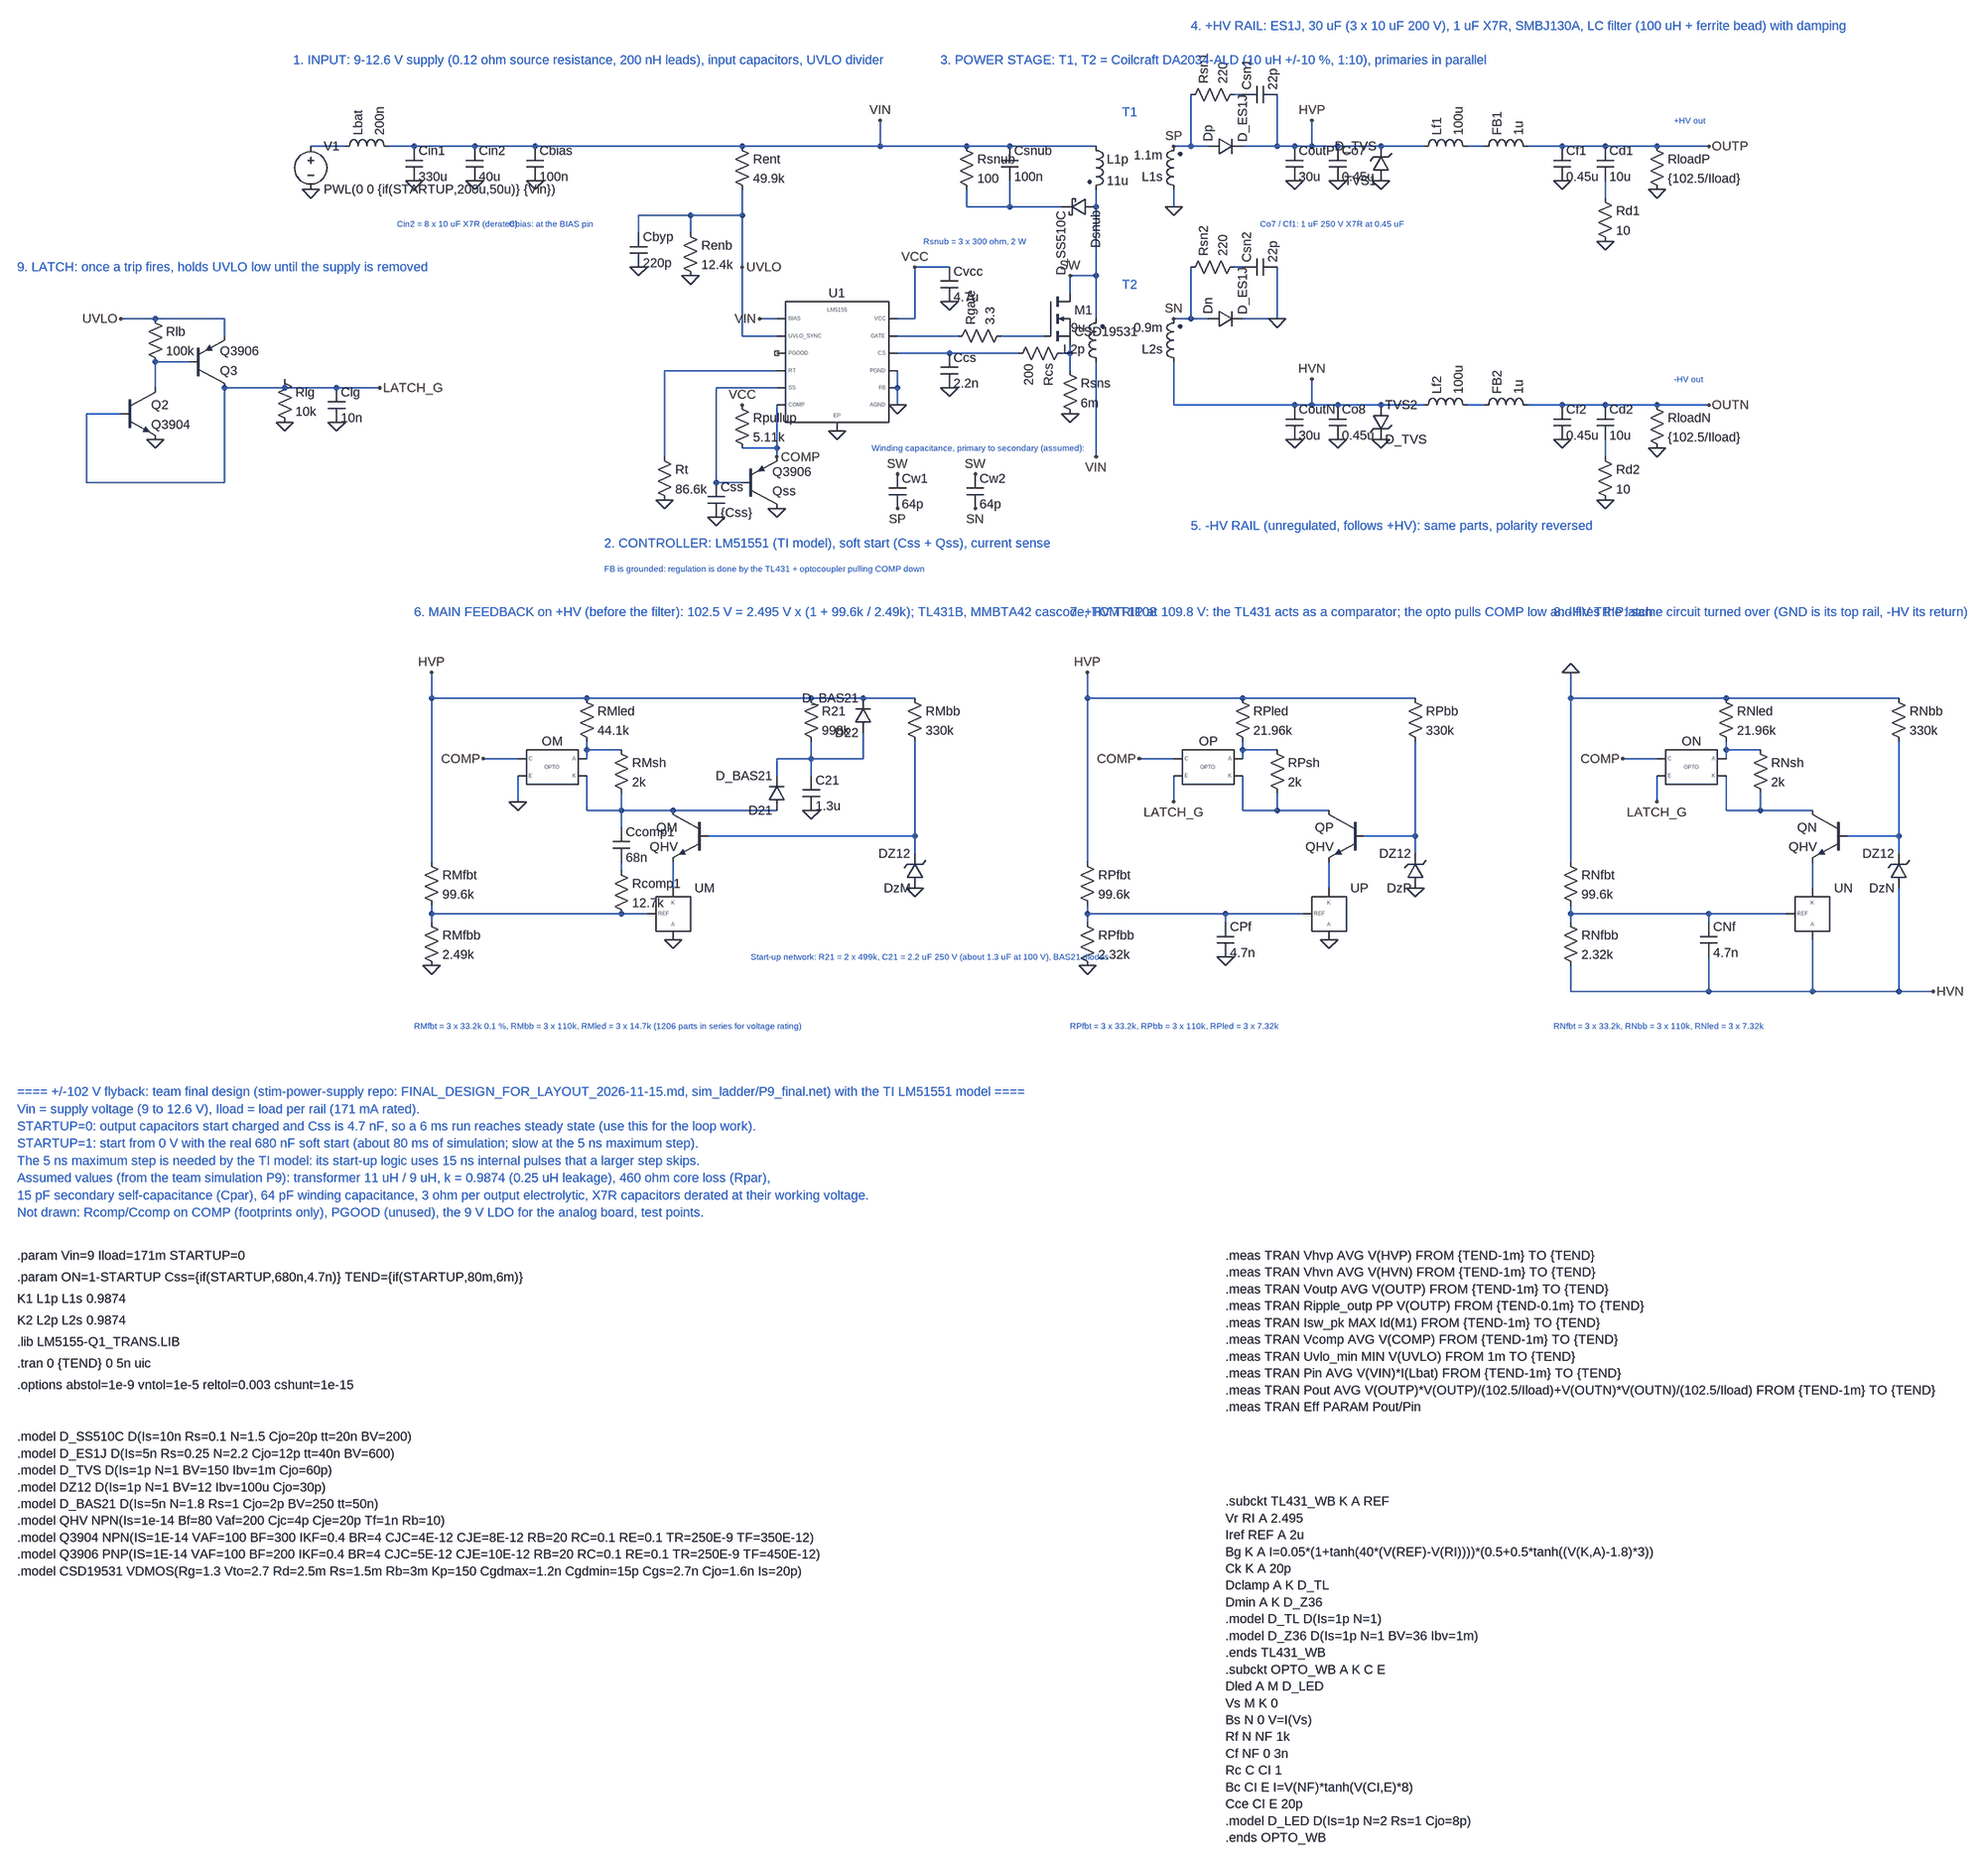
[diagram p0: schematic LM51551_flyback_team_final.asc]
LM51551_flyback_team_final.asc, the LTspice schematic file:
Version 4.1
SHEET 1 3200 2000
WIRE -832 496 -832 624
WIRE -832 496 -768 496
WIRE -832 624 -576 624
WIRE -768 320 -704 320
WIRE -704 320 -576 320
WIRE -704 400 -704 448
WIRE -704 400 -640 400
WIRE -576 320 -576 352
WIRE -576 448 -576 624
WIRE -576 448 -464 448
WIRE -464 432 -464 448
WIRE -464 448 -368 448
WIRE -416 0 -352 0
WIRE -368 448 -288 448
WIRE -272 0 -224 0
WIRE -224 0 -112 0
WIRE -192 976 -192 1024
WIRE -192 1024 -192 1328
WIRE -192 1024 96 1024
WIRE -192 1408 -192 1424
WIRE -192 1424 -192 1440
WIRE -192 1424 64 1424
WIRE -112 0 0 0
WIRE -96 1136 -32 1136
WIRE -32 1168 -32 1216
WIRE 0 0 384 0
WIRE 64 1424 160 1424
WIRE 96 1024 512 1024
WIRE 96 1104 96 1120
WIRE 96 1120 96 1136
WIRE 96 1120 160 1120
WIRE 96 1168 96 1232
WIRE 96 1232 160 1232
WIRE 160 1200 160 1232
WIRE 160 1232 160 1264
WIRE 160 1232 256 1232
WIRE 160 1328 160 1344
WIRE 160 1424 208 1424
WIRE 192 128 192 160
WIRE 192 128 288 128
WIRE 240 416 240 576
WIRE 240 416 448 416
WIRE 256 1232 448 1232
WIRE 256 1328 256 1376
WIRE 288 128 288 160
WIRE 288 128 384 128
WIRE 320 1280 704 1280
WIRE 336 448 336 624
WIRE 336 448 448 448
WIRE 336 624 384 624
WIRE 384 0 640 0
WIRE 384 80 384 128
WIRE 384 128 384 224
WIRE 384 224 384 352
WIRE 384 352 448 352
WIRE 384 560 448 560
WIRE 416 320 448 320
WIRE 448 480 448 560
WIRE 448 560 448 576
WIRE 448 1136 448 1168
WIRE 448 1136 512 1136
WIRE 512 1024 608 1024
WIRE 512 1104 512 1136
WIRE 512 1136 512 1168
WIRE 512 1136 608 1136
WIRE 608 1024 704 1024
WIRE 608 1088 608 1136
WIRE 640 -48 640 0
WIRE 640 0 800 0
WIRE 672 320 704 320
WIRE 672 352 784 352
WIRE 672 384 768 384
WIRE 672 416 672 448
WIRE 672 448 672 480
WIRE 704 224 704 320
WIRE 704 224 768 224
WIRE 704 1104 704 1280
WIRE 704 1280 704 1312
WIRE 768 384 896 384
WIRE 800 0 880 0
WIRE 800 80 800 112
WIRE 800 112 880 112
WIRE 864 352 944 352
WIRE 880 0 1040 0
WIRE 880 64 880 112
WIRE 880 112 976 112
WIRE 976 384 992 384
WIRE 992 240 992 272
WIRE 992 240 1040 240
WIRE 992 368 992 384
WIRE 992 384 992 416
WIRE 1024 976 1024 1024
WIRE 1024 1024 1024 1328
WIRE 1024 1024 1312 1024
WIRE 1024 1408 1024 1424
WIRE 1024 1424 1024 1440
WIRE 1024 1424 1280 1424
WIRE 1040 80 1040 112
WIRE 1040 112 1040 240
WIRE 1040 240 1040 320
WIRE 1040 400 1040 576
WIRE 1120 1136 1184 1136
WIRE 1184 0 1216 0
WIRE 1184 80 1184 112
WIRE 1184 320 1216 320
WIRE 1184 400 1184 480
WIRE 1184 480 1408 480
WIRE 1184 1168 1184 1216
WIRE 1216 -96 1216 0
WIRE 1216 0 1248 0
WIRE 1216 224 1216 320
WIRE 1216 320 1248 320
WIRE 1280 1424 1280 1440
WIRE 1280 1424 1376 1424
WIRE 1296 -96 1312 -96
WIRE 1296 224 1312 224
WIRE 1312 0 1376 0
WIRE 1312 320 1376 320
WIRE 1312 1024 1632 1024
WIRE 1312 1104 1312 1120
WIRE 1312 1120 1312 1136
WIRE 1312 1120 1376 1120
WIRE 1312 1168 1312 1232
WIRE 1312 1232 1376 1232
WIRE 1376 -96 1376 0
WIRE 1376 0 1408 0
WIRE 1376 224 1376 320
WIRE 1376 1200 1376 1232
WIRE 1376 1232 1472 1232
WIRE 1376 1424 1424 1424
WIRE 1408 0 1440 0
WIRE 1408 480 1440 480
WIRE 1440 -48 1440 0
WIRE 1440 0 1488 0
WIRE 1440 432 1440 480
WIRE 1440 480 1488 480
WIRE 1472 1328 1472 1376
WIRE 1488 0 1568 0
WIRE 1488 480 1568 480
WIRE 1536 1280 1632 1280
WIRE 1568 0 1648 0
WIRE 1568 480 1648 480
WIRE 1632 1104 1632 1280
WIRE 1632 1280 1632 1312
WIRE 1728 0 1760 0
WIRE 1728 480 1760 480
WIRE 1840 0 1904 0
WIRE 1840 480 1904 480
WIRE 1904 0 1984 0
WIRE 1904 480 1984 480
WIRE 1920 976 1920 1024
WIRE 1920 1024 1920 1328
WIRE 1920 1024 2208 1024
WIRE 1920 1408 1920 1424
WIRE 1920 1424 1920 1440
WIRE 1920 1424 2176 1424
WIRE 1920 1520 1920 1568
WIRE 1920 1568 2176 1568
WIRE 1984 0 2080 0
WIRE 1984 64 1984 96
WIRE 1984 480 2080 480
WIRE 1984 544 1984 576
WIRE 2016 1136 2080 1136
WIRE 2080 0 2176 0
WIRE 2080 480 2176 480
WIRE 2080 1168 2080 1216
WIRE 2176 1424 2176 1440
WIRE 2176 1424 2272 1424
WIRE 2176 1504 2176 1568
WIRE 2176 1568 2368 1568
WIRE 2208 1024 2528 1024
WIRE 2208 1104 2208 1120
WIRE 2208 1120 2208 1136
WIRE 2208 1120 2272 1120
WIRE 2208 1168 2208 1232
WIRE 2208 1232 2272 1232
WIRE 2272 1200 2272 1232
WIRE 2272 1232 2368 1232
WIRE 2272 1424 2320 1424
WIRE 2368 1328 2368 1376
WIRE 2368 1472 2368 1568
WIRE 2368 1568 2528 1568
WIRE 2432 1280 2528 1280
WIRE 2528 1104 2528 1280
WIRE 2528 1280 2528 1312
WIRE 2528 1376 2528 1568
WIRE 2528 1568 2592 1568
FLAG -416 80 0
FLAG -224 64 0
FLAG -112 64 0
FLAG 0 64 0
FLAG 288 240 0
FLAG 192 224 0
FLAG 384 224 UVLO
FLAG 416 320 VIN
FLAG 240 656 0
FLAG 336 688 0
FLAG 448 672 0
FLAG 384 480 VCC
FLAG 448 576 COMP
FLAG 768 288 0
FLAG 704 224 VCC
FLAG 672 480 0
FLAG 560 528 0
FLAG 1040 576 VIN
FLAG 640 -48 VIN
FLAG 992 240 SW
FLAG 992 496 0
FLAG 768 448 0
FLAG 1184 112 0
FLAG 672 608 SW
FLAG 672 672 SP
FLAG 816 608 SW
FLAG 816 672 SN
FLAG 1184 0 SP
FLAG 1408 64 0
FLAG 1488 64 0
FLAG 1568 64 0
FLAG 1904 64 0
FLAG 1984 176 0
FLAG 2080 80 0
FLAG 2176 0 OUTP
FLAG 1440 -48 HVP
FLAG 1184 320 SN
FLAG 1376 320 0
FLAG 1408 544 0
FLAG 1488 544 0
FLAG 1568 544 0
FLAG 1904 544 0
FLAG 1984 656 0
FLAG 2080 560 0
FLAG 2176 480 OUTN
FLAG 1440 432 HVN
FLAG -192 976 HVP
FLAG -96 1136 COMP
FLAG -32 1216 0
FLAG 512 1232 0
FLAG -192 1520 0
FLAG 256 1472 0
FLAG 704 1376 0
FLAG 1024 976 HVP
FLAG 1120 1136 COMP
FLAG 1184 1216 LATCH_G
FLAG 1024 1520 0
FLAG 1472 1472 0
FLAG 1632 1376 0
FLAG 1280 1504 0
FLAG 1920 976 0
FLAG 2016 1136 COMP
FLAG 2080 1216 LATCH_G
FLAG 2592 1568 HVN
FLAG -768 320 UVLO
FLAG -704 544 0
FLAG -464 512 0
FLAG -368 512 0
FLAG -288 448 LATCH_G
SYMBOL voltage -416 -16 R0
SYMATTR InstName V1
SYMATTR Value PWL(0 0 {if(STARTUP,200u,50u)} {Vin})
SYMATTR SpiceLine Rser=0.12
SYMBOL ind -368 16 R270
SYMATTR InstName Lbat
SYMATTR Value 200n
SYMBOL cap -240 0 R0
SYMATTR InstName Cin1
SYMATTR Value 330u
SYMATTR SpiceLine Rser=0.25
SYMBOL cap -128 0 R0
SYMATTR InstName Cin2
SYMATTR Value 40u
SYMATTR SpiceLine Rser=1m
SYMBOL cap -16 0 R0
SYMATTR InstName Cbias
SYMATTR Value 100n
SYMATTR SpiceLine Rser=70m
SYMBOL res 368 -16 R0
SYMATTR InstName Rent
SYMATTR Value 49.9k
SYMBOL res 272 144 R0
SYMATTR InstName Renb
SYMATTR Value 12.4k
SYMBOL cap 176 160 R0
SYMATTR InstName Cbyp
SYMATTR Value 220p
SYMBOL LM5155_WB 560 400 R0
SYMATTR InstName U1
SYMATTR SpiceLine LM51551=1 FAST_HICCUP=1
SYMBOL res 224 560 R0
SYMATTR InstName Rt
SYMATTR Value 86.6k
SYMBOL cap 320 624 R0
SYMATTR InstName Css
SYMATTR Value {Css}
SYMBOL pnp 384 672 M180
SYMATTR InstName Qss
SYMATTR Value Q3906
SYMBOL res 368 464 R0
SYMATTR InstName Rpullup
SYMATTR Value 5.11k
SYMBOL cap 752 224 R0
SYMATTR InstName Cvcc
SYMATTR Value 4.7u
SYMATTR SpiceLine Rser=3.7m IC={6.85*ON}
SYMBOL ind2 1024 -16 R0
SYMATTR InstName L1p
SYMATTR Value 11u
SYMATTR SpiceLine Rser=18m Rpar=460
SYMBOL ind2 1056 416 R180
SYMATTR InstName L2p
SYMATTR Value 9u
SYMATTR SpiceLine Rser=18m Rpar=460
SYMBOL res 784 -16 R0
SYMATTR InstName Rsnub
SYMATTR Value 100
SYMBOL cap 864 0 R0
SYMATTR InstName Csnub
SYMATTR Value 100n
SYMBOL schottky 1040 96 R90
SYMATTR InstName Dsnub
SYMATTR Value D_SS510C
SYMBOL nmos 944 272 R0
SYMATTR InstName M1
SYMATTR Value CSD19531
SYMBOL res 768 368 R270
SYMATTR InstName Rgate
SYMATTR Value 3.3
SYMBOL res 976 400 R0
SYMATTR InstName Rsns
SYMATTR Value 6m
SYMBOL res 992 368 R90
SYMATTR InstName Rcs
SYMATTR Value 200
SYMBOL cap 752 384 R0
SYMATTR InstName Ccs
SYMATTR Value 2.2n
SYMBOL ind2 1200 96 R180
SYMATTR InstName L1s
SYMATTR Value 1.1m
SYMATTR SpiceLine Rser=1.75 Cpar=15p
SYMBOL ind2 1200 416 R180
SYMATTR InstName L2s
SYMATTR Value 0.9m
SYMATTR SpiceLine Rser=1.75 Cpar=15p
SYMBOL cap 656 608 R0
SYMATTR InstName Cw1
SYMATTR Value 64p
SYMBOL cap 800 608 R0
SYMATTR InstName Cw2
SYMATTR Value 64p
SYMATTR SpiceLine IC={97*ON}
SYMBOL diode 1248 16 R270
SYMATTR InstName Dp
SYMATTR Value D_ES1J
SYMBOL res 1200 -80 R270
SYMATTR InstName Rsn1
SYMATTR Value 220
SYMBOL cap 1312 -80 R270
SYMATTR InstName Csn1
SYMATTR Value 22p
SYMATTR SpiceLine IC={-102*ON}
SYMBOL cap 1392 0 R0
SYMATTR InstName CoutP
SYMATTR Value 30u
SYMATTR SpiceLine Rser=1 IC={102*ON}
SYMBOL cap 1472 0 R0
SYMATTR InstName Co7
SYMATTR Value 0.45u
SYMATTR SpiceLine Rser=20m IC={102*ON}
SYMBOL zener 1584 64 R180
SYMATTR InstName TVS1
SYMATTR Value D_TVS
SYMBOL ind 1632 16 R270
SYMATTR InstName Lf1
SYMATTR Value 100u
SYMATTR SpiceLine Rser=0.35
SYMBOL ind 1744 16 R270
SYMATTR InstName FB1
SYMATTR Value 1u
SYMATTR SpiceLine Rser=0.1
SYMBOL cap 1888 0 R0
SYMATTR InstName Cf1
SYMATTR Value 0.45u
SYMATTR SpiceLine Rser=20m IC={102*ON}
SYMBOL cap 1968 0 R0
SYMATTR InstName Cd1
SYMATTR Value 10u
SYMATTR SpiceLine Rser=3 IC={102*ON}
SYMBOL res 1968 80 R0
SYMATTR InstName Rd1
SYMATTR Value 10
SYMBOL res 2064 -16 R0
SYMATTR InstName RloadP
SYMATTR Value {102.5/Iload}
SYMBOL diode 1248 336 R270
SYMATTR InstName Dn
SYMATTR Value D_ES1J
SYMBOL res 1200 240 R270
SYMATTR InstName Rsn2
SYMATTR Value 220
SYMBOL cap 1312 240 R270
SYMATTR InstName Csn2
SYMATTR Value 22p
SYMATTR SpiceLine IC={-97*ON}
SYMBOL cap 1392 480 R0
SYMATTR InstName CoutN
SYMATTR Value 30u
SYMATTR SpiceLine Rser=1 IC={-97*ON}
SYMBOL cap 1472 480 R0
SYMATTR InstName Co8
SYMATTR Value 0.45u
SYMATTR SpiceLine Rser=20m IC={-97*ON}
SYMBOL zener 1552 480 R0
SYMATTR InstName TVS2
SYMATTR Value D_TVS
SYMBOL ind 1632 496 R270
SYMATTR InstName Lf2
SYMATTR Value 100u
SYMATTR SpiceLine Rser=0.35
SYMBOL ind 1744 496 R270
SYMATTR InstName FB2
SYMATTR Value 1u
SYMATTR SpiceLine Rser=0.1
SYMBOL cap 1888 480 R0
SYMATTR InstName Cf2
SYMATTR Value 0.45u
SYMATTR SpiceLine Rser=20m IC={-97*ON}
SYMBOL cap 1968 480 R0
SYMATTR InstName Cd2
SYMATTR Value 10u
SYMATTR SpiceLine Rser=3 IC={-97*ON}
SYMBOL res 1968 560 R0
SYMATTR InstName Rd2
SYMATTR Value 10
SYMBOL res 2064 464 R0
SYMATTR InstName RloadN
SYMATTR Value {102.5/Iload}
SYMBOL res 80 1008 R0
SYMATTR InstName RMled
SYMATTR Value 44.1k
SYMBOL OPTO_WB 32 1152 R0
SYMATTR InstName OM
SYMBOL res 144 1104 R0
SYMATTR InstName RMsh
SYMATTR Value 2k
SYMBOL npn 320 1232 M0
SYMATTR InstName QM
SYMATTR Value QHV
SYMBOL TL431_WB 256 1424 M0
SYMATTR InstName UM
SYMBOL res 688 1008 R0
SYMATTR InstName RMbb
SYMATTR Value 330k
SYMBOL zener 720 1376 R180
SYMATTR InstName DzM
SYMATTR Value DZ12
SYMBOL res -208 1312 R0
SYMATTR InstName RMfbt
SYMATTR Value 99.6k
SYMBOL res -208 1424 R0
SYMATTR InstName RMfbb
SYMATTR Value 2.49k
SYMBOL cap 144 1264 R0
SYMATTR InstName Ccomp1
SYMATTR Value 68n
SYMATTR SpiceLine IC={22.5*ON}
SYMBOL res 144 1328 R0
SYMATTR InstName Rcomp1
SYMATTR Value 12.7k
SYMBOL res 496 1008 R0
SYMATTR InstName R21
SYMATTR Value 998k
SYMBOL cap 496 1168 R0
SYMATTR InstName C21
SYMATTR Value 1.3u
SYMATTR SpiceLine IC={102*ON}
SYMBOL diode 464 1232 R180
SYMATTR InstName D21
SYMATTR Value D_BAS21
SYMBOL diode 624 1088 R180
SYMATTR InstName D22
SYMATTR Value D_BAS21
SYMBOL res 1296 1008 R0
SYMATTR InstName RPled
SYMATTR Value 21.96k
SYMBOL OPTO_WB 1248 1152 R0
SYMATTR InstName OP
SYMBOL res 1360 1104 R0
SYMATTR InstName RPsh
SYMATTR Value 2k
SYMBOL npn 1536 1232 M0
SYMATTR InstName QP
SYMATTR Value QHV
SYMBOL TL431_WB 1472 1424 M0
SYMATTR InstName UP
SYMBOL res 1616 1008 R0
SYMATTR InstName RPbb
SYMATTR Value 330k
SYMBOL zener 1648 1376 R180
SYMATTR InstName DzP
SYMATTR Value DZ12
SYMBOL res 1008 1312 R0
SYMATTR InstName RPfbt
SYMATTR Value 99.6k
SYMBOL res 1008 1424 R0
SYMATTR InstName RPfbb
SYMATTR Value 2.32k
SYMBOL cap 1264 1440 R0
SYMATTR InstName CPf
SYMATTR Value 4.7n
SYMATTR SpiceLine IC={2.33*ON}
SYMBOL res 2192 1008 R0
SYMATTR InstName RNled
SYMATTR Value 21.96k
SYMBOL OPTO_WB 2144 1152 R0
SYMATTR InstName ON
SYMBOL res 2256 1104 R0
SYMATTR InstName RNsh
SYMATTR Value 2k
SYMBOL npn 2432 1232 M0
SYMATTR InstName QN
SYMATTR Value QHV
SYMBOL TL431_WB 2368 1424 M0
SYMATTR InstName UN
SYMBOL res 2512 1008 R0
SYMATTR InstName RNbb
SYMATTR Value 330k
SYMBOL zener 2544 1376 R180
SYMATTR InstName DzN
SYMATTR Value DZ12
SYMBOL res 1904 1312 R0
SYMATTR InstName RNfbt
SYMATTR Value 99.6k
SYMBOL res 1904 1424 R0
SYMATTR InstName RNfbb
SYMATTR Value 2.32k
SYMBOL cap 2160 1440 R0
SYMATTR InstName CNf
SYMATTR Value 4.7n
SYMATTR SpiceLine IC={2.34*ON}
SYMBOL pnp -640 448 M180
SYMATTR InstName Q3
SYMATTR Value Q3906
SYMBOL res -720 304 R0
SYMATTR InstName Rlb
SYMATTR Value 100k
SYMBOL npn -768 448 R0
SYMATTR InstName Q2
SYMATTR Value Q3904
SYMBOL res -480 416 R0
SYMATTR InstName Rlg
SYMATTR Value 10k
SYMBOL cap -384 448 R0
SYMATTR InstName Clg
SYMATTR Value 10n
TEXT -448 -160 Left 2 ;1. INPUT: 9-12.6 V supply (0.12 ohm source resistance, 200 nH leads), input capacitors, UVLO divider
TEXT -256 144 Left 1 ;Cin2 = 8 x 10 uF X7R (derated)
TEXT -48 144 Left 1 ;Cbias: at the BIAS pin
TEXT 128 736 Left 2 ;2. CONTROLLER: LM51551 (TI model), soft start (Css + Qss), current sense
TEXT 128 784 Left 1 ;FB is grounded: regulation is done by the TL431 + optocoupler pulling COMP down
TEXT 752 -160 Left 2 ;3. POWER STAGE: T1, T2 = Coilcraft DA2034-ALD (10 uH +/-10 %, 1:10), primaries in parallel
TEXT 720 176 Left 1 ;Rsnub = 3 x 300 ohm, 2 W
TEXT 1088 -64 Left 2 ;T1
TEXT 1088 256 Left 2 ;T2
TEXT 624 560 Left 1 ;Winding capacitance, primary to secondary (assumed):
TEXT 1216 -224 Left 2 ;4. +HV RAIL: ES1J, 30 uF (3 x 10 uF 200 V), 1 uF X7R, SMBJ130A, LC filter (100 uH + ferrite bead) with damping
TEXT 1344 144 Left 1 ;Co7 / Cf1: 1 uF 250 V X7R at 0.45 uF
TEXT 2112 -48 Left 1 ;+HV out
TEXT 1216 704 Left 2 ;5. -HV RAIL (unregulated, follows +HV): same parts, polarity reversed
TEXT 2112 432 Left 1 ;-HV out
TEXT -224 864 Left 2 ;6. MAIN FEEDBACK on +HV (before the filter): 102.5 V = 2.495 V x (1 + 99.6k / 2.49k); TL431B, MMBTA42 cascode, TCMT1108
TEXT 400 1504 Left 1 ;Start-up network: R21 = 2 x 499k, C21 = 2.2 uF 250 V (about 1.3 uF at 100 V), BAS21 diodes
TEXT -224 1632 Left 1 ;RMfbt = 3 x 33.2k 0.1 %, RMbb = 3 x 110k, RMled = 3 x 14.7k (1206 parts in series for voltage rating)
TEXT 992 864 Left 2 ;7. +HV TRIP at 109.8 V: the TL431 acts as a comparator; the opto pulls COMP low and fires the latch
TEXT 992 1632 Left 1 ;RPfbt = 3 x 33.2k, RPbb = 3 x 110k, RPled = 3 x 7.32k
TEXT 1888 864 Left 2 ;8. -HV TRIP: same circuit turned over (GND is its top rail, -HV its return)
TEXT 1888 1632 Left 1 ;RNfbt = 3 x 33.2k, RNbb = 3 x 110k, RNled = 3 x 7.32k
TEXT -960 224 Left 2 ;9. LATCH: once a trip fires, holds UVLO low until the supply is removed
TEXT -960 1824 Left 2 ;==== +/-102 V flyback: team final design (stim-power-supply repo: FINAL_DESIGN_FOR_LAYOUT_2026-11-15.md, sim_ladder/P9_final.net) with the TI LM51551 model ====
TEXT -960 1856 Left 2 ;Vin = supply voltage (9 to 12.6 V), Iload = load per rail (171 mA rated).
TEXT -960 1888 Left 2 ;STARTUP=0: output capacitors start charged and Css is 4.7 nF, so a 6 ms run reaches steady state (use this for the loop work).
TEXT -960 1920 Left 2 ;STARTUP=1: start from 0 V with the real 680 nF soft start (about 80 ms of simulation; slow at the 5 ns maximum step).
TEXT -960 1952 Left 2 ;The 5 ns maximum step is needed by the TI model: its start-up logic uses 15 ns internal pulses that a larger step skips.
TEXT -960 1984 Left 2 ;Assumed values (from the team simulation P9): transformer 11 uH / 9 uH, k = 0.9874 (0.25 uH leakage), 460 ohm core loss (Rpar),
TEXT -960 2016 Left 2 ;15 pF secondary self-capacitance (Cpar), 64 pF winding capacitance, 3 ohm per output electrolytic, X7R capacitors derated at their working voltage.
TEXT -960 2048 Left 2 ;Not drawn: Rcomp/Ccomp on COMP (footprints only), PGOOD (unused), the 9 V LDO for the analog board, test points.
TEXT -960 2128 Left 2 !.param Vin=9 Iload=171m STARTUP=0
TEXT -960 2168 Left 2 !.param ON=1-STARTUP Css={if(STARTUP,680n,4.7n)} TEND={if(STARTUP,80m,6m)}
TEXT -960 2208 Left 2 !K1 L1p L1s 0.9874
TEXT -960 2248 Left 2 !K2 L2p L2s 0.9874
TEXT -960 2288 Left 2 !.lib LM5155-Q1_TRANS.LIB
TEXT -960 2328 Left 2 !.tran 0 {TEND} 0 5n uic
TEXT -960 2368 Left 2 !.options abstol=1e-9 vntol=1e-5 reltol=0.003 cshunt=1e-15
TEXT 1280 2128 Left 2 !.meas TRAN Vhvp AVG V(HVP) FROM {TEND-1m} TO {TEND}\n.meas TRAN Vhvn AVG V(HVN) FROM {TEND-1m} TO {TEND}\n.meas TRAN Voutp AVG V(OUTP) FROM {TEND-1m} TO {TEND}\n.meas TRAN Ripple_outp PP V(OUTP) FROM {TEND-0.1m} TO {TEND}\n.meas TRAN Isw_pk MAX Id(M1) FROM {TEND-1m} TO {TEND}\n.meas TRAN Vcomp AVG V(COMP) FROM {TEND-1m} TO {TEND}\n.meas TRAN Uvlo_min MIN V(UVLO) FROM 1m TO {TEND}\n.meas TRAN Pin AVG V(VIN)*I(Lbat) FROM {TEND-1m} TO {TEND}\n.meas TRAN Pout AVG V(OUTP)*V(OUTP)/(102.5/Iload)+V(OUTN)*V(OUTN)/(102.5/Iload) FROM {TEND-1m} TO {TEND}\n.meas TRAN Eff PARAM Pout/Pin
TEXT -960 2464 Left 2 !.model D_SS510C D(Is=10n Rs=0.1 N=1.5 Cjo=20p tt=20n BV=200)\n.model D_ES1J D(Is=5n Rs=0.25 N=2.2 Cjo=12p tt=40n BV=600)\n.model D_TVS D(Is=1p N=1 BV=150 Ibv=1m Cjo=60p)\n.model DZ12 D(Is=1p N=1 BV=12 Ibv=100u Cjo=30p)\n.model D_BAS21 D(Is=5n N=1.8 Rs=1 Cjo=2p BV=250 tt=50n)\n.model QHV NPN(Is=1e-14 Bf=80 Vaf=200 Cjc=4p Cje=20p Tf=1n Rb=10)\n.model Q3904 NPN(IS=1E-14 VAF=100 BF=300 IKF=0.4 BR=4 CJC=4E-12 CJE=8E-12 RB=20 RC=0.1 RE=0.1 TR=250E-9 TF=350E-12)\n.model Q3906 PNP(IS=1E-14 VAF=100 BF=200 IKF=0.4 BR=4 CJC=5E-12 CJE=10E-12 RB=20 RC=0.1 RE=0.1 TR=250E-9 TF=450E-12)\n.model CSD19531 VDMOS(Rg=1.3 Vto=2.7 Rd=2.5m Rs=1.5m Rb=3m Kp=150 Cgdmax=1.2n Cgdmin=15p Cgs=2.7n Cjo=1.6n Is=20p)
TEXT 1280 2584 Left 2 !.subckt TL431_WB K A REF\nVr RI A 2.495\nIref REF A 2u\nBg K A I=0.05*(1+tanh(40*(V(REF)-V(RI))))*(0.5+0.5*tanh((V(K,A)-1.8)*3))\nCk K A 20p\nDclamp A K D_TL\nDmin A K D_Z36\n.model D_TL D(Is=1p N=1)\n.model D_Z36 D(Is=1p N=1 BV=36 Ibv=1m)\n.ends TL431_WB\n.subckt OPTO_WB A K C E\nDled A M D_LED\nVs M K 0\nBs N 0 V=I(Vs)\nRf N NF 1k\nCf NF 0 3n\nRc C CI 1\nBc CI E I=V(NF)*tanh(V(CI,E)*8)\nCce CI E 20p\n.model D_LED D(Is=1p N=2 Rs=1 Cjo=8p)\n.ends OPTO_WB

The netlist it stands for:
* LM51551_flyback_team_final.asc
V1 N002 0 PWL(0 0 {if(STARTUP,200u,50u)} {Vin}) Rser=0.12
Lbat N002 VIN 200n
Cin1 VIN 0 330u Rser=0.25
Cin2 VIN 0 40u Rser=1m
Cbias VIN 0 100n Rser=70m
Rent VIN UVLO 49.9k
Renb UVLO 0 12.4k
Cbyp UVLO 0 220p
X§U1 0 VIN COMP N013 0 0 N012 0 NC_01 N007 N010 UVLO VCC LM5155-Q1_TRANS LM51551=1 FAST_HICCUP=1  ; pins AGND BIAS COMP CS EP FB GATE PGND PGOOD RT SS UVLO_SYNC VCC
Rt N007 0 86.6k
Css N010 0 {Css}
Qss 0 N010 COMP 0 Q3906
Rpullup VCC COMP 5.11k
Cvcc VCC 0 4.7u Rser=3.7m IC={6.85*ON}
L1p VIN SW 11u Rser=18m Rpar=460
L2p VIN SW 9u Rser=18m Rpar=460
Rsnub VIN N014 100
Csnub VIN N014 100n
Dsnub SW N014 D_SS510C
M1 SW N015 N016 N016 CSD19531
Rgate N012 N015 3.3
Rsns N016 0 6m
Rcs N016 N013 200
Ccs N013 0 2.2n
L1s 0 SP 1.1m Rser=1.75 Cpar=15p
L2s HVN SN 0.9m Rser=1.75 Cpar=15p
Cw1 SW SP 64p
Cw2 SW SN 64p IC={97*ON}
Dp SP HVP D_ES1J
Rsn1 SP N018 220
Csn1 N018 HVP 22p IC={-102*ON}
CoutP HVP 0 30u Rser=1 IC={102*ON}
Co7 HVP 0 0.45u Rser=20m IC={102*ON}
D§TVS1 0 HVP D_TVS
Lf1 HVP N024 100u Rser=0.35
L§FB1 N024 OUTP 1u Rser=0.1
Cf1 OUTP 0 0.45u Rser=20m IC={102*ON}
Cd1 OUTP N027 10u Rser=3 IC={102*ON}
Rd1 N027 0 10
RloadP OUTP 0 {102.5/Iload}
Dn SN 0 D_ES1J
Rsn2 SN N019 220
Csn2 N019 0 22p IC={-97*ON}
CoutN HVN 0 30u Rser=1 IC={-97*ON}
Co8 HVN 0 0.45u Rser=20m IC={-97*ON}
D§TVS2 HVN 0 D_TVS
Lf2 HVN N025 100u Rser=0.35
L§FB2 N025 OUTN 1u Rser=0.1
Cf2 OUTN 0 0.45u Rser=20m IC={-97*ON}
Cd2 OUTN N028 10u Rser=3 IC={-97*ON}
Rd2 N028 0 10
RloadN OUTN 0 {102.5/Iload}
RMled HVP N004 44.1k
X§OM N004 N005 COMP 0 OPTO_WB  ; pins A K C E
RMsh N004 N005 2k
QM N005 N009 N008 0 QHV
X§UM N008 0 N003 TL431_WB  ; pins K A REF
RMbb HVP N009 330k
DzM 0 N009 DZ12
RMfbt HVP N003 99.6k
RMfbb N003 0 2.49k
Ccomp1 N005 N006 68n IC={22.5*ON}
Rcomp1 N006 N003 12.7k
R21 HVP N011 998k
C21 N011 0 1.3u IC={102*ON}
D21 N005 N011 D_BAS21
D22 N011 HVP D_BAS21
RPled HVP N020 21.96k
X§OP N020 N021 COMP LATCH_G OPTO_WB  ; pins A K C E
RPsh N020 N021 2k
QP N021 N023 N022 0 QHV
X§UP N022 0 N017 TL431_WB  ; pins K A REF
RPbb HVP N023 330k
DzP 0 N023 DZ12
RPfbt HVP N017 99.6k
RPfbb N017 0 2.32k
CPf N017 0 4.7n IC={2.33*ON}
RNled 0 N029 21.96k
X§ON N029 N030 COMP LATCH_G OPTO_WB  ; pins A K C E
RNsh N029 N030 2k
QN N030 N032 N031 0 QHV
X§UN N031 HVN N026 TL431_WB  ; pins K A REF
RNbb 0 N032 330k
DzN HVN N032 DZ12
RNfbt 0 N026 99.6k
RNfbb N026 HVN 2.32k
CNf N026 HVN 4.7n IC={2.34*ON}
Q3 LATCH_G N001 UVLO 0 Q3906
Rlb UVLO N001 100k
Q2 N001 LATCH_G 0 0 Q3904
Rlg LATCH_G 0 10k
Clg LATCH_G 0 10n
.model D D
.lib standard.dio
.model NPN NPN
.model PNP PNP
.lib standard.bjt
.model NMOS NMOS
.model PMOS PMOS
.lib standard.mos
* 1. INPUT: 9-12.6 V supply (0.12 ohm source resistance, 200 nH leads), input capacitors, UVLO divider
* Cin2 = 8 x 10 uF X7R (derated)
* Cbias: at the BIAS pin
* 2. CONTROLLER: LM51551 (TI model), soft start (Css + Qss), current sense
* FB is grounded: regulation is done by the TL431 + optocoupler pulling COMP down
* 3. POWER STAGE: T1, T2 = Coilcraft DA2034-ALD (10 uH +/-10 %, 1:10), primaries in parallel
* Rsnub = 3 x 300 ohm, 2 W
* T1
* T2
* Winding capacitance, primary to secondary (assumed):
* 4. +HV RAIL: ES1J, 30 uF (3 x 10 uF 200 V), 1 uF X7R, SMBJ130A, LC filter (100 uH + ferrite bead) with damping
* Co7 / Cf1: 1 uF 250 V X7R at 0.45 uF
* +HV out
* 5. -HV RAIL (unregulated, follows +HV): same parts, polarity reversed
* -HV out
* 6. MAIN FEEDBACK on +HV (before the filter): 102.5 V = 2.495 V x (1 + 99.6k / 2.49k); TL431B, MMBTA42 cascode, TCMT1108
* Start-up network: R21 = 2 x 499k, C21 = 2.2 uF 250 V (about 1.3 uF at 100 V), BAS21 diodes
* RMfbt = 3 x 33.2k 0.1 %, RMbb = 3 x 110k, RMled = 3 x 14.7k (1206 parts in series for voltage rating)
* 7. +HV TRIP at 109.8 V: the TL431 acts as a comparator; the opto pulls COMP low and fires the latch
* RPfbt = 3 x 33.2k, RPbb = 3 x 110k, RPled = 3 x 7.32k
* 8. -HV TRIP: same circuit turned over (GND is its top rail, -HV its return)
* RNfbt = 3 x 33.2k, RNbb = 3 x 110k, RNled = 3 x 7.32k
* 9. LATCH: once a trip fires, holds UVLO low until the supply is removed
* ==== +/-102 V flyback: team final design (stim-power-supply repo: FINAL_DESIGN_FOR_LAYOUT_2026-11-15.md, sim_ladder/P9_final.net) with the TI LM51551 model ====
* Vin = supply voltage (9 to 12.6 V), Iload = load per rail (171 mA rated).
* STARTUP=0: output capacitors start charged and Css is 4.7 nF, so a 6 ms run reaches steady state (use this for the loop work).
* STARTUP=1: start from 0 V with the real 680 nF soft start (about 80 ms of simulation; slow at the 5 ns maximum step).
* The 5 ns maximum step is needed by the TI model: its start-up logic uses 15 ns internal pulses that a larger step skips.
* Assumed values (from the team simulation P9): transformer 11 uH / 9 uH, k = 0.9874 (0.25 uH leakage), 460 ohm core loss (Rpar),
* 15 pF secondary self-capacitance (Cpar), 64 pF winding capacitance, 3 ohm per output electrolytic, X7R capacitors derated at their working voltage.
* Not drawn: Rcomp/Ccomp on COMP (footprints only), PGOOD (unused), the 9 V LDO for the analog board, test points.
.param Vin=9 Iload=171m STARTUP=0
.param ON=1-STARTUP Css={if(STARTUP,680n,4.7n)} TEND={if(STARTUP,80m,6m)}
K1 L1p L1s 0.9874
K2 L2p L2s 0.9874
.lib LM5155-Q1_TRANS.LIB
.tran 0 {TEND} 0 5n uic
.options abstol=1e-9 vntol=1e-5 reltol=0.003 cshunt=1e-15
.meas TRAN Vhvp AVG V(HVP) FROM {TEND-1m} TO {TEND}
.meas TRAN Vhvn AVG V(HVN) FROM {TEND-1m} TO {TEND}
.meas TRAN Voutp AVG V(OUTP) FROM {TEND-1m} TO {TEND}
.meas TRAN Ripple_outp PP V(OUTP) FROM {TEND-0.1m} TO {TEND}
.meas TRAN Isw_pk MAX Id(M1) FROM {TEND-1m} TO {TEND}
.meas TRAN Vcomp AVG V(COMP) FROM {TEND-1m} TO {TEND}
.meas TRAN Uvlo_min MIN V(UVLO) FROM 1m TO {TEND}
.meas TRAN Pin AVG V(VIN)*I(Lbat) FROM {TEND-1m} TO {TEND}
.meas TRAN Pout AVG V(OUTP)*V(OUTP)/(102.5/Iload)+V(OUTN)*V(OUTN)/(102.5/Iload) FROM {TEND-1m} TO {TEND}
.meas TRAN Eff PARAM Pout/Pin
.model D_SS510C D(Is=10n Rs=0.1 N=1.5 Cjo=20p tt=20n BV=200)
.model D_ES1J D(Is=5n Rs=0.25 N=2.2 Cjo=12p tt=40n BV=600)
.model D_TVS D(Is=1p N=1 BV=150 Ibv=1m Cjo=60p)
.model DZ12 D(Is=1p N=1 BV=12 Ibv=100u Cjo=30p)
.model D_BAS21 D(Is=5n N=1.8 Rs=1 Cjo=2p BV=250 tt=50n)
.model QHV NPN(Is=1e-14 Bf=80 Vaf=200 Cjc=4p Cje=20p Tf=1n Rb=10)
.model Q3904 NPN(IS=1E-14 VAF=100 BF=300 IKF=0.4 BR=4 CJC=4E-12 CJE=8E-12 RB=20 RC=0.1 RE=0.1 TR=250E-9 TF=350E-12)
.model Q3906 PNP(IS=1E-14 VAF=100 BF=200 IKF=0.4 BR=4 CJC=5E-12 CJE=10E-12 RB=20 RC=0.1 RE=0.1 TR=250E-9 TF=450E-12)
.model CSD19531 VDMOS(Rg=1.3 Vto=2.7 Rd=2.5m Rs=1.5m Rb=3m Kp=150 Cgdmax=1.2n Cgdmin=15p Cgs=2.7n Cjo=1.6n Is=20p)
.subckt TL431_WB K A REF
Vr RI A 2.495
Iref REF A 2u
Bg K A I=0.05*(1+tanh(40*(V(REF)-V(RI))))*(0.5+0.5*tanh((V(K,A)-1.8)*3))
Ck K A 20p
Dclamp A K D_TL
Dmin A K D_Z36
.model D_TL D(Is=1p N=1)
.model D_Z36 D(Is=1p N=1 BV=36 Ibv=1m)
.ends TL431_WB
.subckt OPTO_WB A K C E
Dled A M D_LED
Vs M K 0
Bs N 0 V=I(Vs)
Rf N NF 1k
Cf NF 0 3n
Rc C CI 1
Bc CI E I=V(NF)*tanh(V(CI,E)*8)
Cce CI E 20p
.model D_LED D(Is=1p N=2 Rs=1 Cjo=8p)
.ends OPTO_WB
.backanno
.end